# Altium schematic sheet Top-Sheet.SchDoc
size 420 x 297 mm; DocumentNumber: 1; SheetNumber: 1; SheetTotal: 4
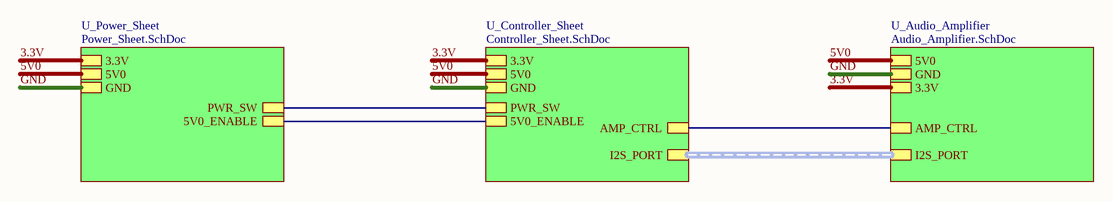
[diagram p0: Top-Sheet.SchDoc]

## Sub-sheets
U_Audio_Amplifier = Audio_Amplifier.SchDoc: I2S_PORT (harness I2S_PORT), GND, 5V0, AMP_CTRL, 3.3V
U_Controller_Sheet = Controller_Sheet.SchDoc: I2S_PORT (harness I2S_PORT), GND, PWR_SW, 5V0_ENABLE, 3.3V, AMP_CTRL, 5V0
U_Power_Sheet = Power_Sheet.SchDoc: GND, PWR_SW, 5V0_ENABLE, 3.3V, 5V0

## Nets
3.3V: sheet U_Audio_Amplifier/3.3V, sheet U_Controller_Sheet/3.3V, sheet U_Power_Sheet/3.3V
5V0: sheet U_Audio_Amplifier/5V0, sheet U_Controller_Sheet/5V0, sheet U_Power_Sheet/5V0
GND: sheet U_Audio_Amplifier/GND, sheet U_Controller_Sheet/GND, sheet U_Power_Sheet/GND
(unnamed): sheet U_Audio_Amplifier/AMP_CTRL, sheet U_Controller_Sheet/AMP_CTRL
(unnamed): sheet U_Controller_Sheet/PWR_SW, sheet U_Power_Sheet/PWR_SW
(unnamed): sheet U_Controller_Sheet/5V0_ENABLE, sheet U_Power_Sheet/5V0_ENABLE

## Buses and harness runs
harness sheet U_Audio_Amplifier/I2S_PORT = sheet U_Controller_Sheet/I2S_PORT

## Notes on the sheet
- File:
- Title:
- Date:
- Page
- Num:
- Total:
- Drawn By: Huzaifa Ali